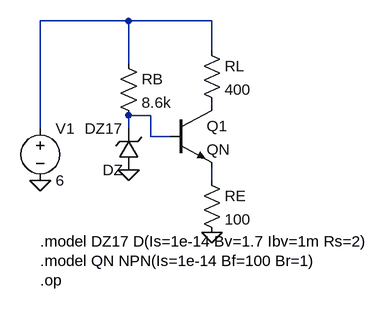
[diagram p0: schematic Ex08.asc]
Ex08.asc, the LTspice schematic file:
Version 4
SHEET 1 880 680
WIRE 80 216 80 50
WIRE 80 50 216 50
WIRE 216 50 216 116
WIRE 216 50 344 50
WIRE 344 50 344 96
WIRE 216 196 216 216
WIRE 216 196 250 196
WIRE 250 196 250 228
WIRE 250 228 280 228
WIRE 344 176 344 180
WIRE 344 276 344 296
FLAG 80 296 0
FLAG 216 280 0
FLAG 344 376 0
SYMBOL voltage 80 200 R0
SYMATTR InstName V1
SYMATTR Value 6
SYMBOL res 200 100 R0
SYMATTR InstName RB
SYMATTR Value 8.6k
SYMBOL zener 232 280 R180
SYMATTR InstName DZ
SYMATTR Value DZ17
SYMBOL res 328 80 R0
SYMATTR InstName RL
SYMATTR Value 400
SYMBOL npn 280 180 R0
SYMATTR InstName Q1
SYMATTR Value QN
SYMBOL res 328 280 R0
SYMATTR InstName RE
SYMATTR Value 100
TEXT 80 390 Left 2 !.model DZ17 D(Is=1e-14 Bv=1.7 Ibv=1m Rs=2)
TEXT 80 420 Left 2 !.model QN NPN(Is=1e-14 Bf=100 Br=1)
TEXT 80 450 Left 2 !.op

The netlist it stands for:
* Ex08.asc
V1 N001 0 6
RB N001 N002 8.6k
DZ 0 N002 DZ17
RL N001 N003 400
Q1 N003 N002 N004 0 QN
RE N004 0 100
.model D D
.lib standard.dio
.model NPN NPN
.model PNP PNP
.lib standard.bjt
.model DZ17 D(Is=1e-14 Bv=1.7 Ibv=1m Rs=2)
.model QN NPN(Is=1e-14 Bf=100 Br=1)
.op
.backanno
.end